# Altium project Car_wash_machine.PrjPcb (part 1 of 5)
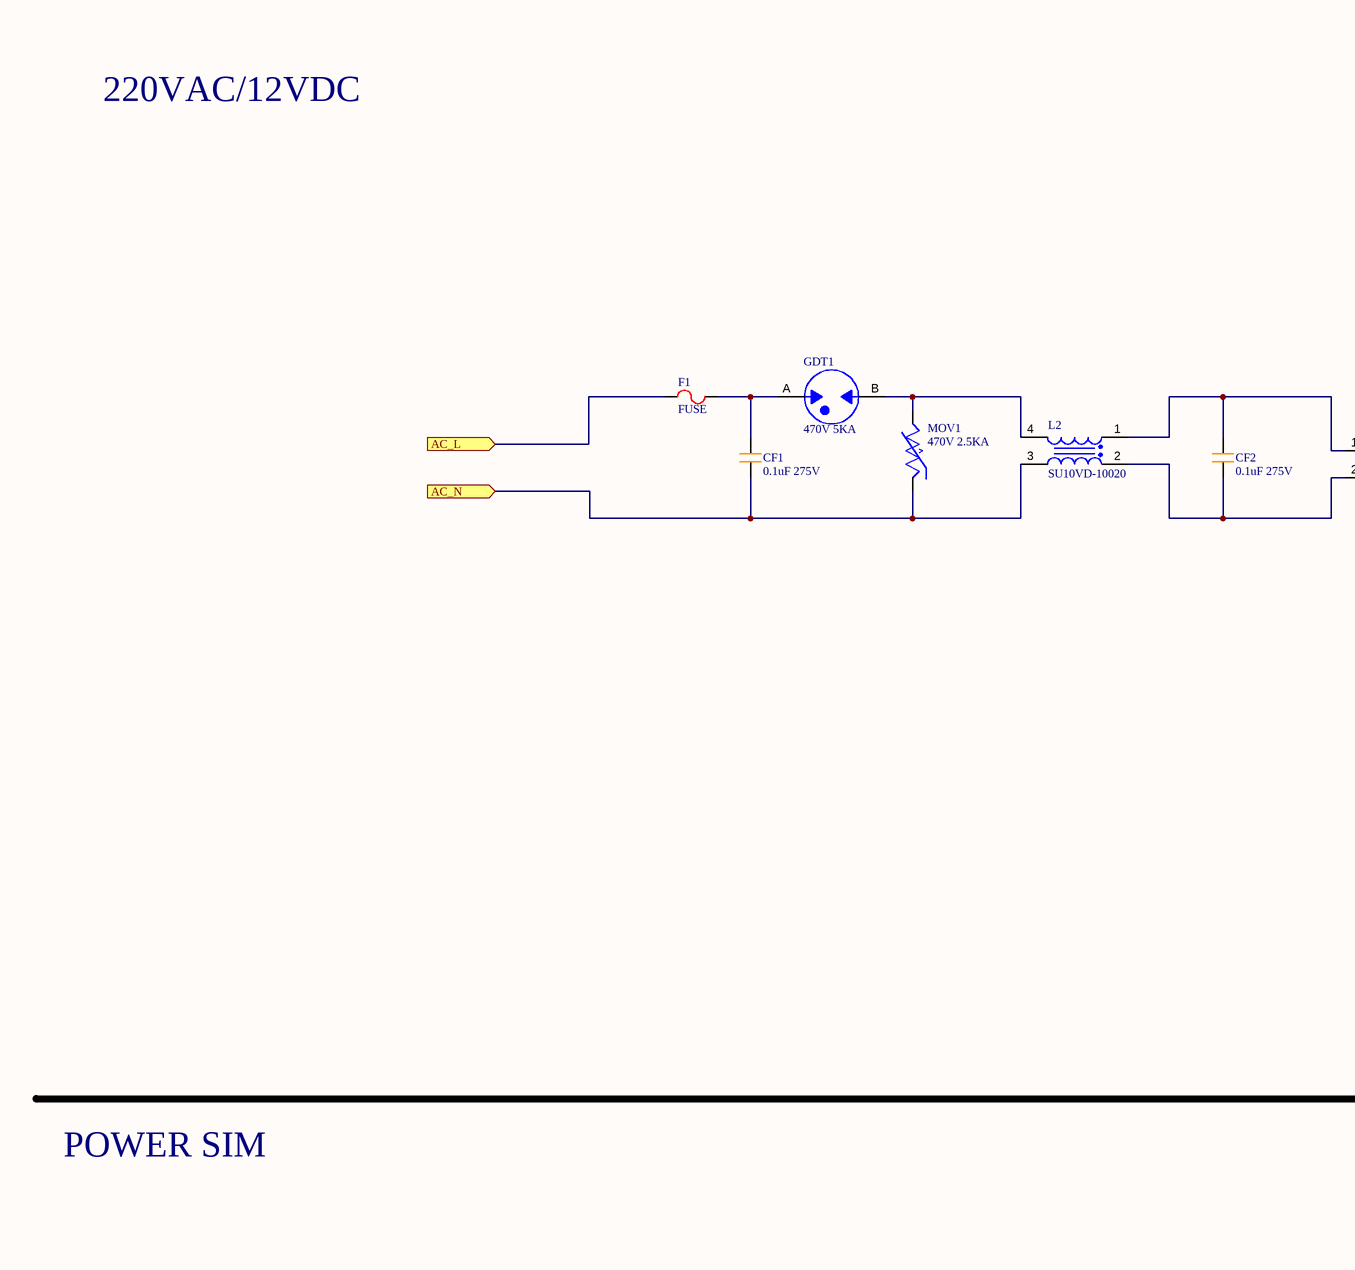
[diagram p0: POWER_CAR_WASH_MACHINE.SchDoc, top left]
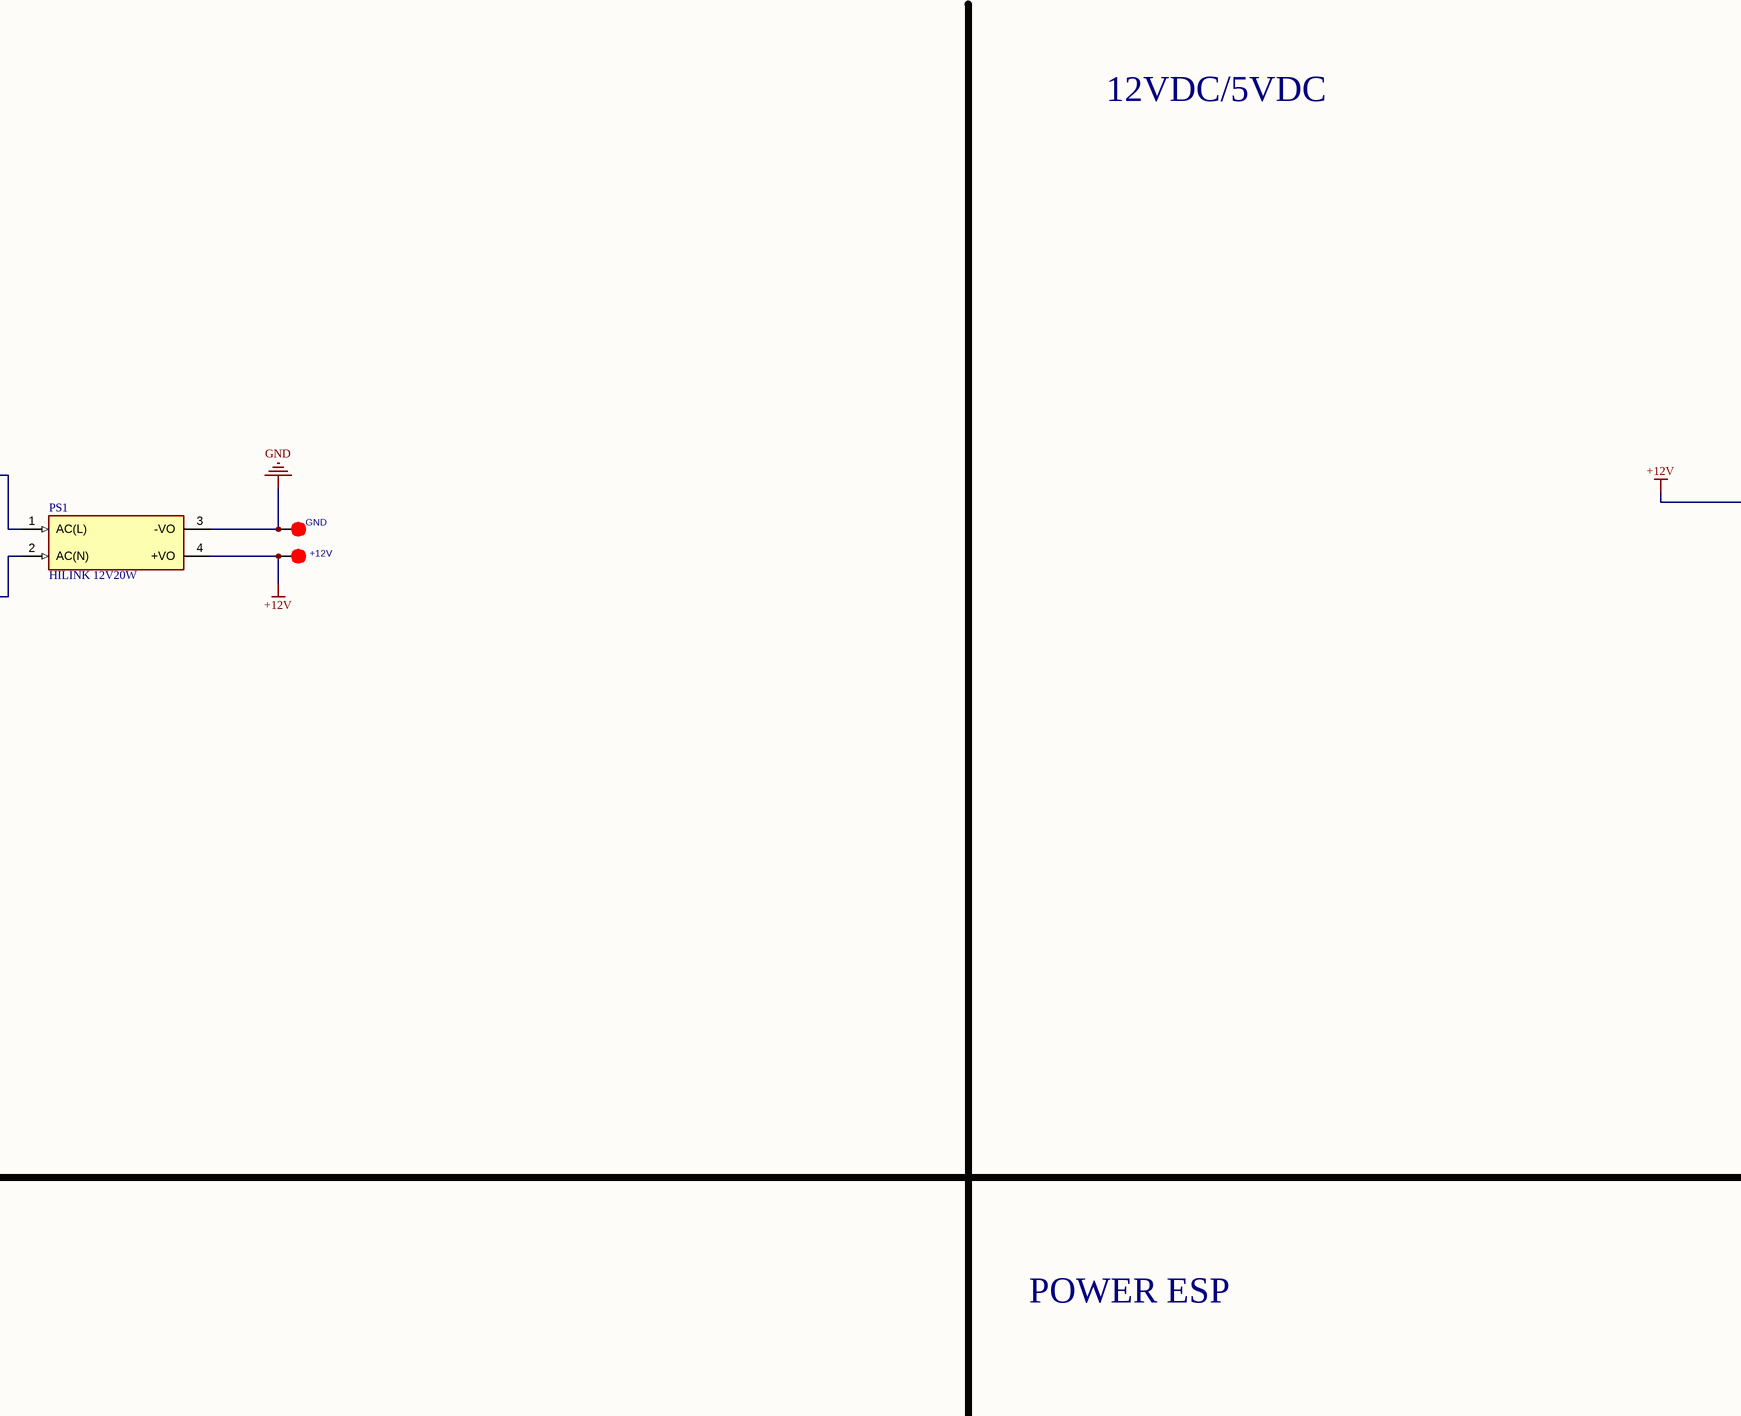
[diagram p1: POWER_CAR_WASH_MACHINE.SchDoc, top middle]
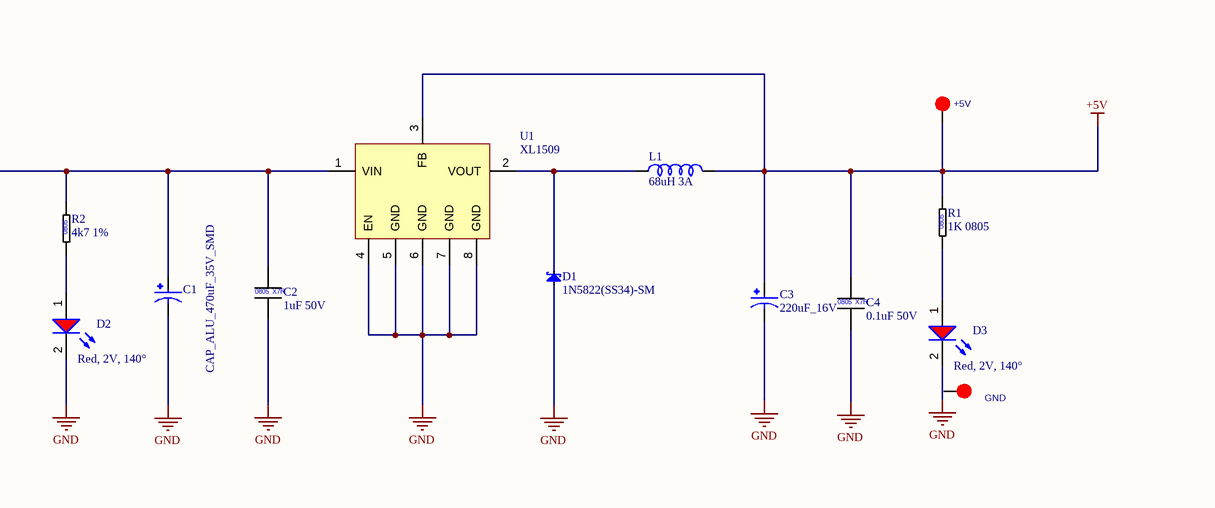
[diagram p2: POWER_CAR_WASH_MACHINE.SchDoc, top right]
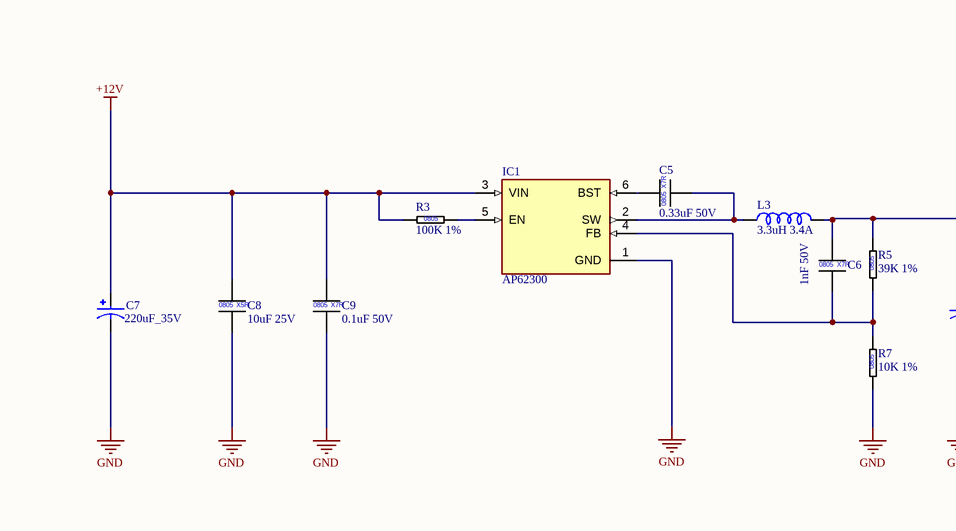
[diagram p3: POWER_CAR_WASH_MACHINE.SchDoc, bottom left]
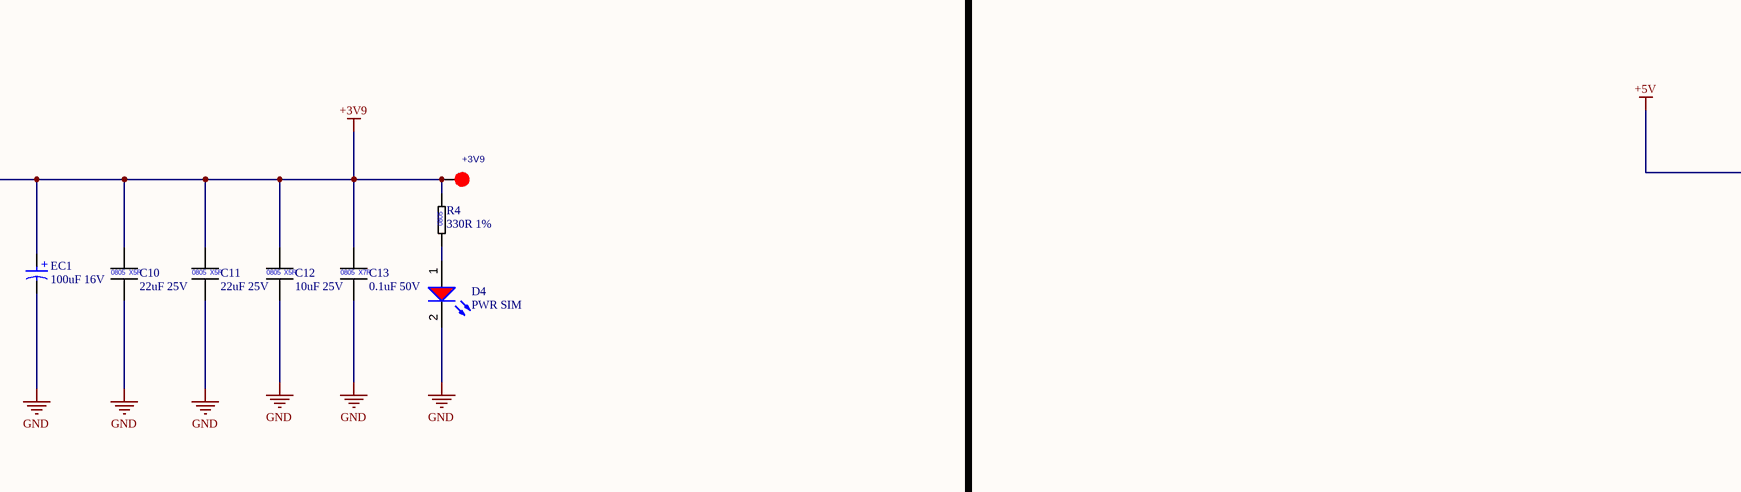
[diagram p4: POWER_CAR_WASH_MACHINE.SchDoc, bottom middle]
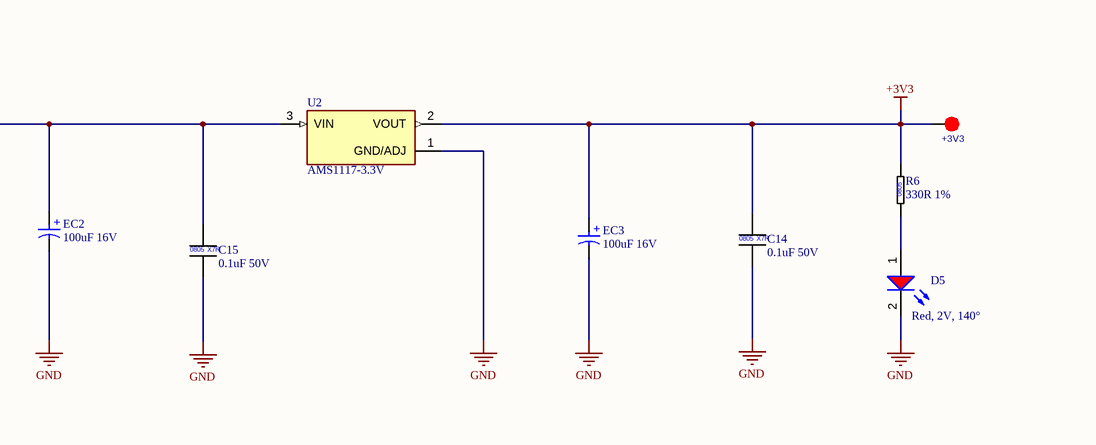
[diagram p5: POWER_CAR_WASH_MACHINE.SchDoc, bottom right]
2 sheets, 256 parts. Net scope: flat (ports and power ports of the same name join across sheets).
Board file: Car_wash_machine.PcbDoc
Sheets:
  POWER_CAR_WASH_MACHINE.SchDoc
  MCU_WASH_MACHINE.SchDoc

## Sheet POWER_CAR_WASH_MACHINE.SchDoc
size 863 x 558 mm; SheetNumber: 1; SheetTotal: 2

### Parts
(Parts that share a designator on the sheet are numbered #1, #2 ... from top to bottom, then left to right.)
+3V3  TP_1MM  [PAD_SMD_D1.2MM]  (value not drawn)  (no BOM)
+3V9  TP_1MM  [PAD_SMD_D1.2MM]  (value not drawn)  (no BOM)
+5V  TP_1MM  [PAD_SMD_D1.2MM - duplicate1]  (value not drawn)  (no BOM)
+12V  TP_1MM  [PAD_SMD_D1.2MM]  (value not drawn)  (no BOM)
C1  CAP_ALU_470uF_35V_SMD  [CAP_ALU_470uF_35V]
C2  1uF 50V  [CAP-CER_0805_L2W1.25H0.8_Wave]
C3  220uF_16V  [CAP ALUM 220UF 20% 16V SMD]
C4  0.1uF 50V  [CAP-CER_0805_L2W1.25H0.6_Wave]
C5  0.33uF 50V  [CAP-CER_0805_L2W1.25H0.6_Wave]
C6  1nF 50V  [CAP-CER_0805_L2W1.25H0.6_Wave]
C7  220uF_35V  [C_FC_220UF_35V]
C8  10uF 25V  [CAP-CER_0805_L2W1.25H0.8_Wave]
C9  0.1uF 50V  [CAP-CER_0805_L2W1.25H0.6_Wave]
C10  22uF 25V  [CAP-CER_0805_L2W1.25H0.6_Wave]
C11  22uF 25V  [CAP-CER_0805_L2W1.25H0.6_Wave]
C12  10uF 25V  [CAP-CER_0805_L2W1.25H0.8_Wave]
C13  0.1uF 50V  [CAP-CER_0805_L2W1.25H0.6_Wave]
C14  0.1uF 50V  [CAP-CER_0805_L2W1.25H0.6_Wave]
C15  0.1uF 50V  [CAP-CER_0805_L2W1.25H0.6_Wave]
CF1  0.1uF 275V  [CAP_FILM_TH; 18x5x11mm; PITCH15MM_LONG-pin]
CF2  0.1uF 275V  [CAP_FILM_TH; 18x5x11mm; PITCH15MM_LONG-pin]
D1  1N5822(SS34)-SM  [SMA-J_DO-214AC]
D2  Red, 2V, 140°  [LED_0805_RED]
D3  Red, 2V, 140°  [LED_0805_RED]
D4  PWR SIM  [LED_0805_RED]
D5  Red, 2V, 140°  [LED_0805_RED]
EC1  100uF 16V  [CAP_ALU;SMD,D6.3H5.8]
EC2  100uF 16V  [CAP_ALU;SMD,D6.3H5.8]
EC3  100uF 16V  [CAP_ALU;SMD,D6.3H5.8]
F1  FUSE  [FUSE_BOX_D5L20MM]
GDT1  470V 5KA  [GDT;470V,5kA]
GND#1  TP_1MM  [PAD_SMD_D1.2MM]  (value not drawn)  (no BOM)
GND#2  TP_1MM  [PAD_SMD_D1.2MM]  (value not drawn)  (no BOM)
IC1  AP62300  [SOT-23-6]
L1  68uH 3A  [12X12_68uH_2A]
L2  SU10VD-10020  [CHOKE_UU10]
L3  3.3uH 3.4A  [IND_SMD 6x6x2.8MM]
MOV1  470V 2.5KA  [VARISTOR_DISC10MM]
PS1  HILINK 12V20W  [MODULE_POWER_HLK-20M05]
R1  1K 0805  [RESISTOR_0805_Wave]
R2  4k7 1%  [RESISTOR_0805_Wave]
R3  100K 1%  [RESISTOR_0805_Wave]
R4  330R 1%  [RESISTOR_0805_Wave]
R5  39K 1%  [RESISTOR_0805_Wave]
R6  330R 1%  [RESISTOR_0805_Wave]
R7  10K 1%  [RESISTOR_0805_Wave]
U1  XL1509  [SOP8]
U2  AMS1117-3.3V  [SOT223]

### Ports
AC_L (in), AC_N (in)

### Nets
+3V3: +3V3.0 C14.1 EC3.1(P) R6.2 U2.2(VOUT)
+3V9: +3V9.0 C6.1 C10.1 C11.1 C12.1 C13.1 EC1.1(P) L3.2 R4.2 R5.2
+5V: +5V.0 C3.1 C4.1 C15.1 EC2.1(P) L1.2 R1.2 U1.3(FB) U2.3(VIN)
+12V: +12V.0 C1.1 C2.1 C7.1 C8.1 C9.1 IC1.3(VIN) PS1.4(+VO) R2.2 R3.1 U1.1(VIN)
GND: C1.2 C2.2 C3.2 C4.2 C7.2 C8.2 C9.2 C10.2 C11.2 C12.2 C13.2 C14.2 C15.2 D1.1 D2.2(K) D3.2(K) D4.2(K) D5.2(K) EC1.2(N) EC2.2(N) EC3.2(N) GND#1.0 IC1.1(GND) PS1.3(-VO) R7.1 U1.4(EN) U1.5(GND) U1.6(GND) U1.7(GND) U1.8(GND) U2.1(GND/ADJ)
NetC5_1: C5.1 IC1.6(BST)
NetC5_2: C5.2 IC1.2(SW) L3.1
NetC6_2: C6.2 IC1.4(FB) R5.1 R7.2
NetCF1_1: CF1.1 L2.3 MOV1.1 ; port AC_N
NetCF1_2: CF1.2 F1.2 GDT1.A
NetCF2_1: CF2.1 L2.2 PS1.2(AC(N))
NetCF2_2: CF2.2 L2.1 PS1.1(AC(L))
NetCN2_1: F1.1 ; port AC_L
NetD1_2: D1.2 L1.1 U1.2(VOUT)
NetD2_1: D2.1(A) R2.1
NetD3_1: D3.1(A) R1.1
NetD4_1: D4.1(A) R4.1
NetD5_1: D5.1(A) R6.1
NetGDT1_B: GDT1.B L2.4 MOV1.2
NetIC1_5: IC1.5(EN) R3.2

Not connected (* = marked no-connect by the designer): GND#2 0

### Notes on the sheet
- 12VDC/5VDC
- 220VAC/12VDC
- POWER SIM
- POWER ESP
- DWG. NO.
- REV.
- SHT.
- REVISION
- DESCRIPTION
- DATE
- APPROVED
- THIS DOCUMENT AND THE DATA DISCLOSED HEREIN OR HEREWITH IS THE PROPERTY OF ALTIUM LIMITED AND MAY BE FREELY DISTRIBUTED IN WHOLE. NO RIGHTS ARE RESERVED OR EXPRESS OR IMPLIED WARANTEE GIVEN.
- ENG:
- DSN:
- APPROVALS
- PROJECT
- DOCUMENT REVISION:
- DESIGN ITEM:
- CHK:
- BOM:
- REFERENCE DOCUMENTS
- PROJECT REVISION:
- TITLE
- FAB DWG:
- PCB DWG:
- ASSY DWG:
- SCALE:
- SIZE
- D
- CAGE CODE
- FILE NAME
- DWG NO.
- SHEET
- OF
- REV
- (in symbol CAP_ALU_SMD; 100UF 20% 16V 6.3x5.5MM) +
- (in symbol CAP_CER_SMD; 0.33UF 50V X7R 0805 10%) X7R
- (in symbol RES_SMD; 1K, 1%, 0805, 1/8W) 0805
- (in symbol RES_SMD; 4.7K, 1%, 0805, 1/8W) 0805
- (in symbol RES_SMD; 10K, 1%, 0805, 1/8W) 0805
- (in symbol RES_SMD; 330R, 1%, 0805, 1/8W) 0805